# EasyEDA Pro project RM26.epro, board PCB2
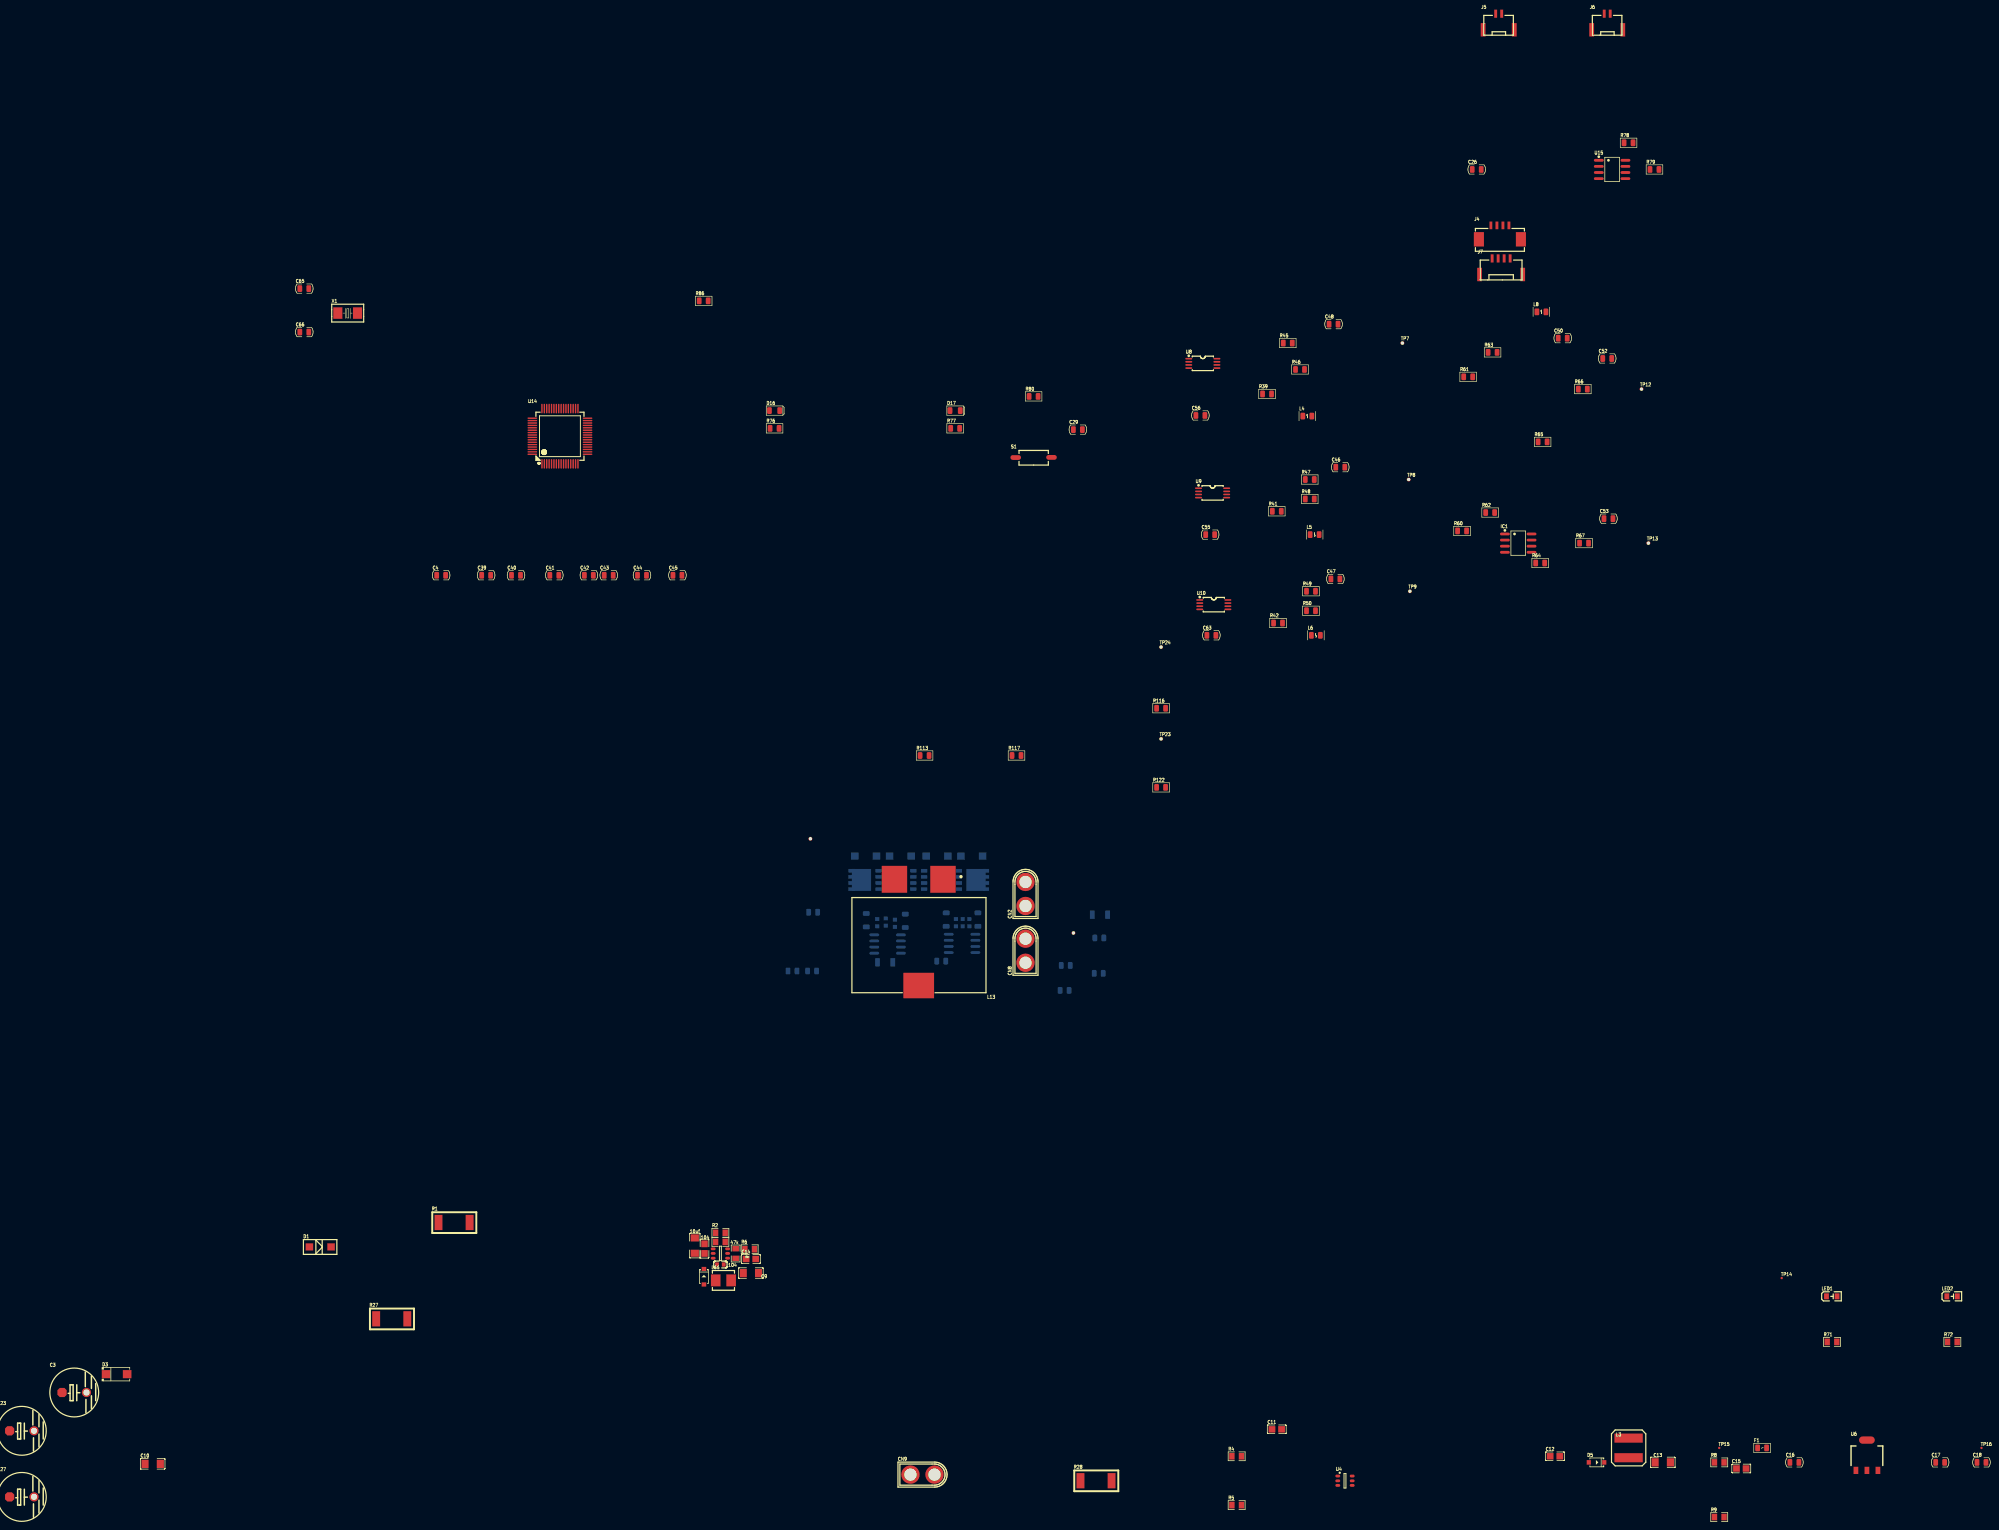
[diagram p2: board, top side]
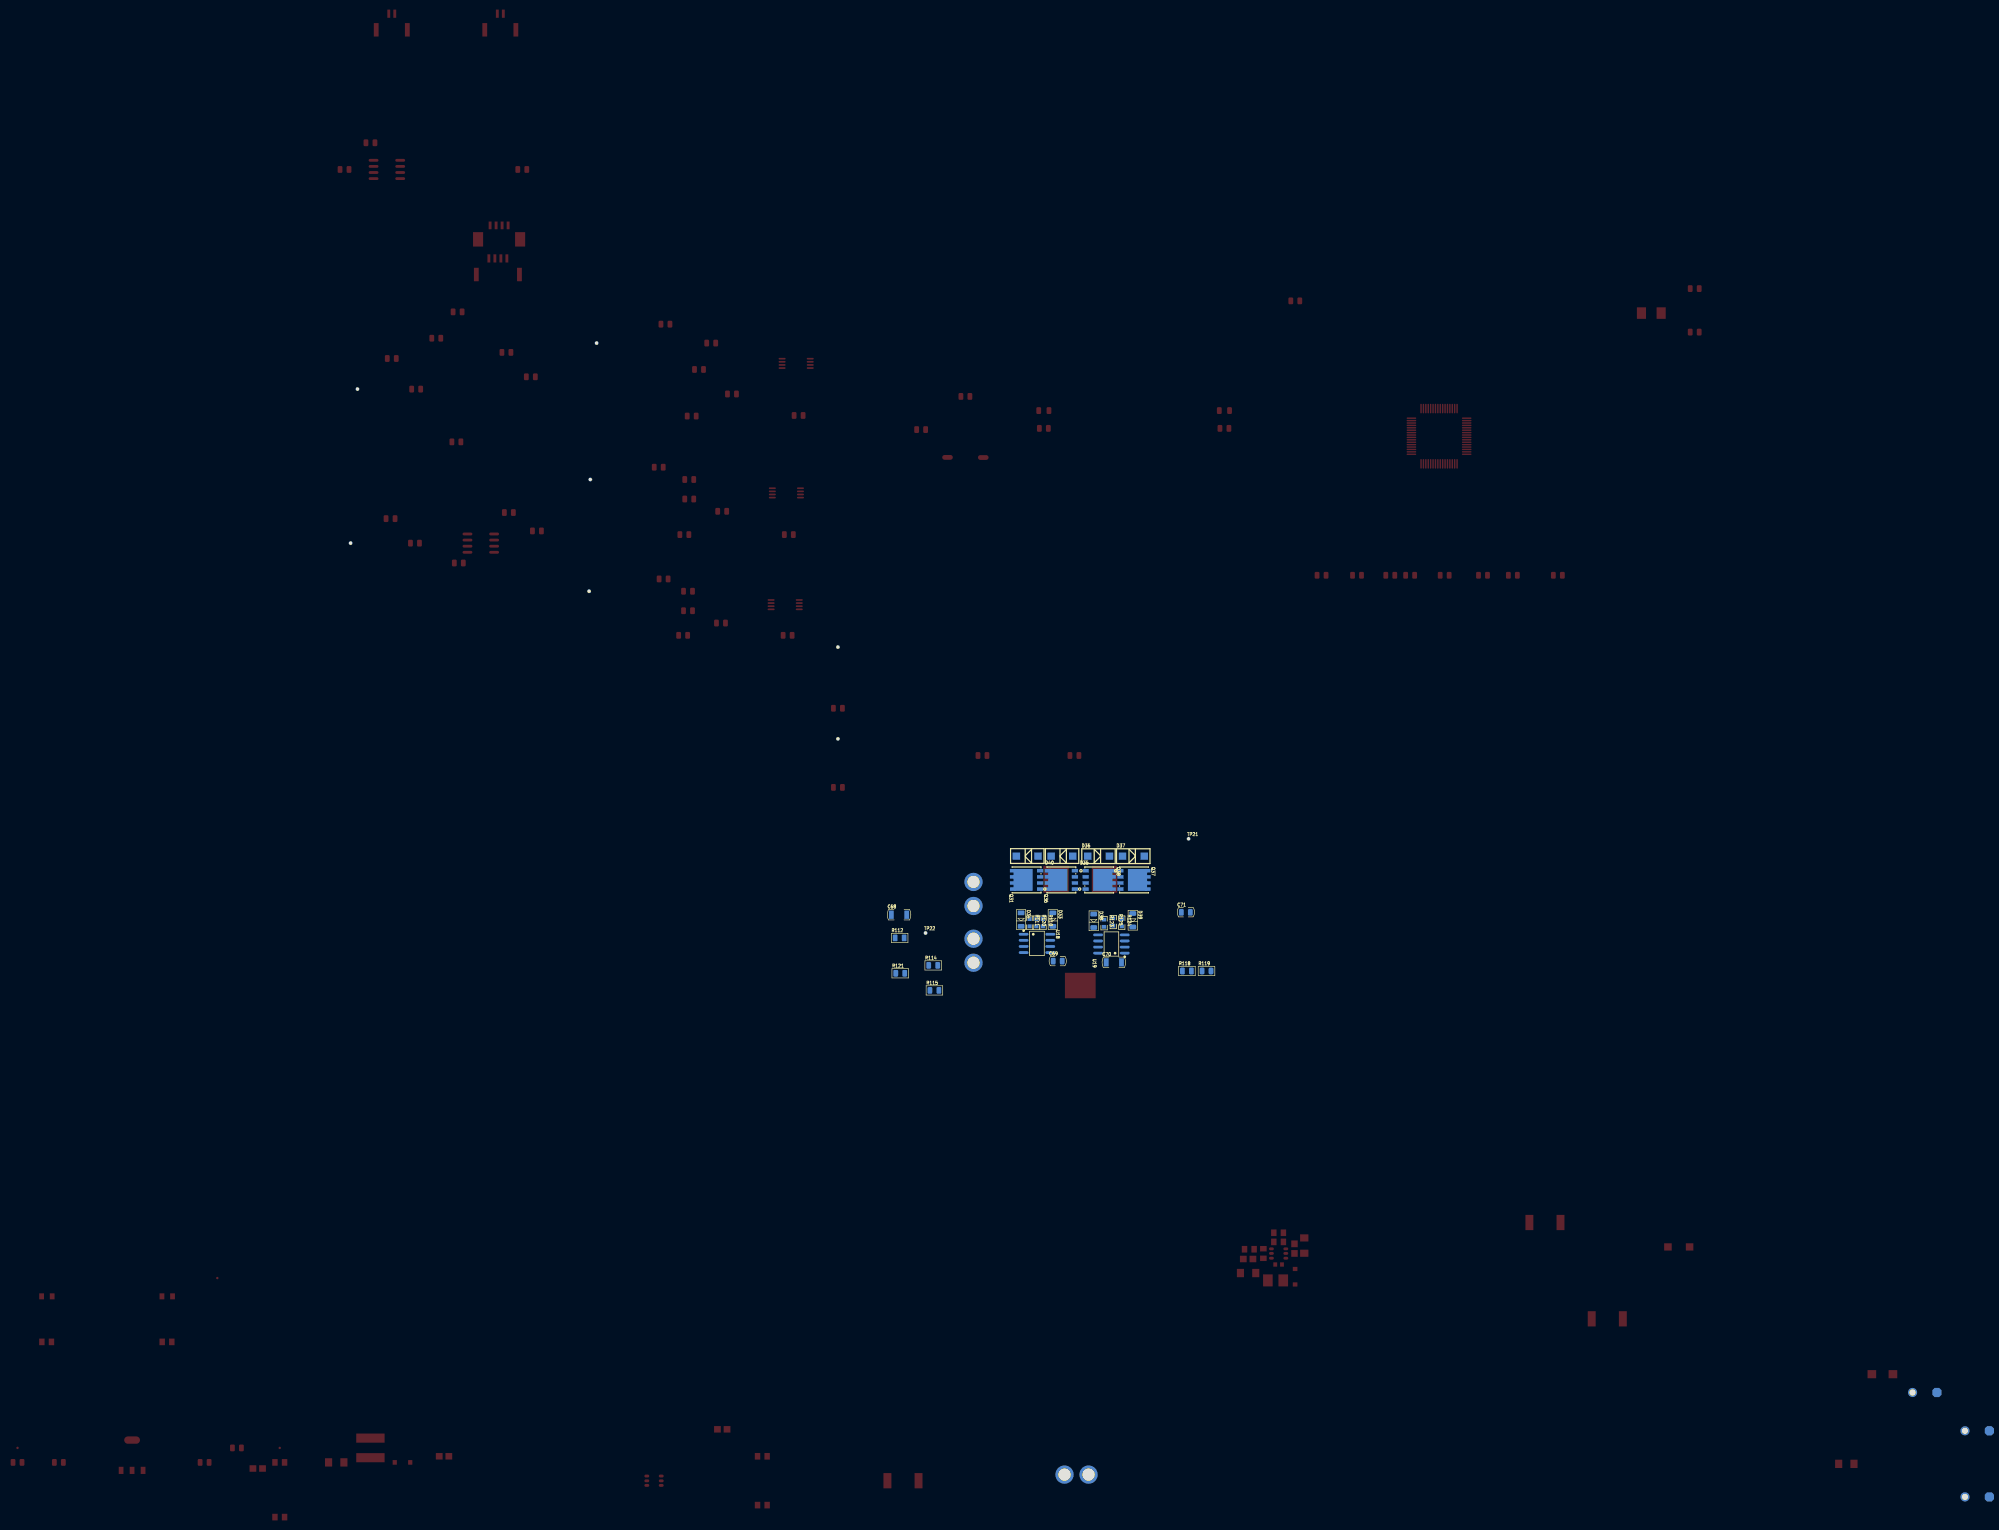
[diagram p3: board, bottom side, seen from below]

No outline. copper layers: Top Layer, Bottom Layer. Coordinates in mm from the lowest, leftmost part position.
Stack: Top Layer 0.035mm / Dielectric1 1.51mm FR4 er 4.5 / Bottom Layer 0.035mm

## Design rules (mm)
template: JLCPCB Capability(Two Layers Board)
spacing copperThickness1oz (default): track to track 0.102, other pairs 0.152 to 0.3
spacing copperThickness2oz: track to track 0.203, other pairs 0.152 to 0.3
track width copperThickness1oz (default): min 0.127, default 0.254, max 2.54
track width copperThickness2oz: min 0.203, default 0.254, max 2.54
differential pair differentialPair (default): width min 0.127, default 0.254, max 2.54; gap min 0.152, default 0.152
via viaSize (default): diameter min 0.5, default 0.61, max 10; hole min 0.3, default 0.305, max 6.3

## Placement (name value [footprint] x y rotation side)
10uf  10uF  [C1206]  140.05 56.48 90 top
47k  47kΩ  [R0805]  145.38 57.25 180 top
104  -  [C0805]  142.08 55.85 90 top
104#2  -  [C0603]  145.38 52.55 180 top
C3  470UF  [C-电解电容]  10.91 25.92 0 top
C4  1UF  [0805-C]  87.27 195.93 0 top
C9  10uF  [C1206]  151.73 50.77 180 top
C10  10uF  [C1206]  27.23 11.07 0 top
C11  104  [C0805]  261.17 18.26 0 top
C12  104  [C0805]  319.07 12.65 0 top
C13  10uF  [C1206]  341.5 11.38 0 top
C14  47pF  [C0805]  151.73 53.69 0 top
C15  33pF  [C0805]  357.84 10.11 0 top
C16  4.7UF  [0805-C]  368.9 11.38 0 top
C17  1UF  [0805-C]  399.23 11.38 0 top
C18  104  [0805-C]  407.83 11.38 0 top
C23  470UF  [C-电解电容]  0 17.95 0 top
C26  104  [0805-C]  302.78 280.36 0 top
C27  470UF  [C-电解电容]  0 4.2 0 top
C29  104  [0805-C]  219.78 226.25 0 top
C39  104  [0805-C]  96.63 195.93 0 top
C40  104  [0805-C]  102.85 195.93 0 top
C41  104  [0805-C]  110.82 195.93 0 top
C42  104  [0805-C]  118.01 195.93 0 top
C43  104  [0805-C]  122.14 195.93 0 top
C44  1UF  [0805-C]  129.06 195.93 0 top
C45  104  [0805-C]  136.44 195.93 0 top
C46  100PF  [0805-C]  274.39 218.42 0 top
C47  100PF  [0805-C]  273.37 195.17 0 top
C48  100PF  [0805-C]  272.99 248.18 0 top
C50  104  [0805-C]  320.68 245.26 0 top
C52  100pf  [0805-C]  329.95 241.04 0 top
C53  100pf  [0805-C]  330.2 207.72 0 top
C55  104  [0805-C]  247.31 204.4 0 top
C56  104  [0805-C]  245.28 229.19 0 top
C63  104  [0805-C]  247.56 183.44 0 top
C65  22PF  [0805-C]  58.79 255.58 0 top
C66  22PF  [0805-C]  58.79 246.53 0 top
C68  4.7UF  [C-1206]  224.38 125.32 180 bottom
C69  104  [0805-C]  191.36 115.67 180 bottom
C70  4.7UF  [C-1206]  179.67 115.41 180 bottom
C71  104  [0805-C]  164.69 125.83 180 bottom
CN2  XT30U-M  [CONN-TH_XT30U-M]  208.88 129.64 90 top
CN8  XT30U-M  [CONN-TH_XT30U-M]  208.88 117.83 90 top
CN9  XT30U-M  [CONN-TH_XT30U-M]  187.44 8.84 0 top
D1  SMBJ30CA  [SMA]  62.1 56.2 0 top
D3  1N5819  [SMA_L4.4-W2.6-LS5.0-RD]  19.73 29.73 0 top
D4  1N4148W  [SOD-123_L2.7-W1.6-LS3.7-FD]  141.95 50.01 90 top
D5  1N4148W  [SOD-123_L2.7-W1.6-LS3.7-FD]  327.72 11.38 0 top
D16  led  [0805-LED]  156.66 230.2 0 top
D17  led  [0805-LED]  194.24 230.2 0 top
D33  1n4148  [1n4148 sod-123]  192.37 124.3 270 bottom
D34  1n4148  [1n4148 sod-123]  198.98 124.3 270 bottom
D35  FR107  [SMA]  190.47 137.51 0 bottom
D36  FR107  [SMA]  182.85 137.51 180 bottom
D37  FR107  [SMA]  175.61 137.51 180 bottom
D38  1n4148  [1n4148 sod-123]  183.86 124.05 270 bottom
D39  1n4148  [1n4148 sod-123]  175.74 124.18 270 bottom
D40  FR107  [SMA]  197.71 137.51 0 bottom
F1  0.5A/0805  [自恢复保险丝-0805]  362.17 14.39 0 top
IC1  OPA2350UA  [OPA2350UA-SOP-8]  311.42 202.62 0 top
J4  CON4  [GH1.25-4P  SWD]  307.61 267.28 0 top
J5  CON2  [GH1.25_2P-立]  307.36 311.09 0 top
J6  CON2  [GH1.25_2P-立]  329.95 311.09 0 top
J7  CON4  [GH1.25_4P-立]  307.86 260.18 0 top
L3  3.3UH/0530  [L-5020/5030]  334.39 14.39 0 top
L4  10UH  [0805-L]  267.53 229.06 0 top
L5  10UH  [0805-L]  269.06 204.4 0 top
L6  10UH  [0805-L]  269.31 183.44 0 top
L8  10UH  [0805-L]  316.25 250.74 0 top
L11  6.8uH  [IND-SMD_L4.6-W4.1_FCH0420]  146.02 49.25 0 top
L13  10uH  [IND-SMD_3P-L27.9-W27.9_PSPQAA2617]  186.66 121.64 180 top
LED1  -  [LED_0805]  376.72 45.92 0 top
LED2  -  [LED_0805]  401.77 45.92 0 top
Q31  BSC066N06NS  [PG-TDSON-8_L5.0-W6.0-P1.27-BL-EP]  197.83 132.56 90 bottom
Q36  BSC066N06NS  [PG-TDSON-8_L5.0-W6.0-P1.27-BL-EP]  190.59 132.56 90 bottom
Q37  BSC066N06NS  [PG-TDSON-8_L5.0-W6.0-P1.27-BL-EP]  175.48 132.56 270 bottom
Q38  BSC066N06NS  [PG-TDSON-8_L5.0-W6.0-P1.27-BL-EP]  182.72 132.56 270 bottom
R1  R005  [R-2512]  89.95 61.28 0 top
R2  200kΩ  [R0805]  145.38 59.15 0 top
R4  200kΩ  [R0805]  252.83 12.65 0 top
R5  47kΩ  [R0805]  252.83 2.49 0 top
R6  124kΩ  [R0805]  151.48 55.72 0 top
R7  8.87kΩ  [R0805]  148.56 54.83 90 top
R8  124kΩ  [R0805]  353.26 11.38 0 top
R9  23.7kΩ  [R0805]  353.26 0 0 top
R27  R005  [R-2512]  76.98 41.25 0 top
R28  R005  [R-2512]  223.56 7.57 0 top
R39  220R  [0805-R]  259.15 233.65 0 top
R41  220R  [0805-R]  261.18 209.24 0 top
R42  220R  [0805-R]  261.44 186 0 top
R45  100R  [0805-R]  263.47 244.24 0 top
R46  220R  [0805-R]  266.01 238.75 0 top
R47  100R  [0805-R]  268.04 215.86 0 top
R48  220R  [0805-R]  268.04 211.8 0 top
R49  100R  [0805-R]  268.29 192.61 0 top
R50  220R  [0805-R]  268.29 188.56 0 top
R60  200K  [0805-R]  299.74 205.16 0 top
R61  200K  [0805-R]  301.01 237.23 0 top
R62  10K  [0805-R]  305.58 208.99 0 top
R63  10K  [0805-R]  306.09 242.31 0 top
R64  10K  [0805-R]  315.99 198.49 0 top
R65  10K  [0805-R]  316.5 223.69 0 top
R66  100R  [0805-R]  324.87 234.67 0 top
R67  100R  [0805-R]  325.12 202.62 0 top
R71  10K  [R0805]  376.72 36.45 0 top
R72  10K  [R0805]  401.77 36.45 0 top
R76  10K  [0805-R]  156.66 226.5 0 top
R77  10K  [0805-R]  194.24 226.5 0 top
R78  10K  [0805-R]  334.38 285.92 0 top
R79  120R  [0805-R]  339.78 280.36 0 top
R80  10K  [0805-R]  210.57 233.15 0 top
R86  10K  [0805-R]  141.91 253.02 0 top
R110  2Ω  [R0603]  194.4 123.67 270 bottom
R111  2Ω  [R0603]  197.2 123.67 270 bottom
R112  10K  [0805-R]  224.25 120.49 180 bottom
R113  10K  [0805-R]  187.88 158.44 0 top
R114  10K  [0805-R]  217.26 114.78 180 bottom
R115  10K  [0805-R]  217.01 109.57 180 bottom
R116  10K  [0805-R]  237.1 168.27 0 top
R117  10K  [0805-R]  207.01 158.44 0 top
R118  10K  [0805-R]  164.46 113.61 180 bottom
R119  10K  [0805-R]  160.38 113.61 180 bottom
R120  4.7Ω  [R0603]  195.8 123.67 270 bottom
R121  10K  [0805-R]  224.12 113.13 180 bottom
R122  10K  [0805-R]  237.1 151.8 0 top
R123  2Ω  [R0603]  181.7 123.54 270 bottom
R124  2Ω  [R0603]  178.02 123.67 270 bottom
R125  4.7Ω  [R0603]  179.8 123.79 270 bottom
S1  -  [按键]  210.57 220.45 0 top
TP7  测试点  [测试点-1MM有孔]  287.31 244.24 0 top
TP8  测试点  [测试点-1MM有孔]  288.62 215.86 0 top
TP9  测试点  [测试点-1MM有孔]  288.88 192.61 0 top
TP12  测试点  [测试点-1MM有孔]  337.08 234.67 0 top
TP13  测试点  [测试点-1MM有孔]  338.51 202.62 0 top
TP14  -  [Test-Point-0.5mm]  366.26 49.73 0 top
TP15  -  [Test-Point-0.5mm]  353.26 14.39 0 top
TP16  -  [Test-Point-0.5mm]  407.83 14.39 0 top
TP21  测试点  [测试点-1MM有孔]  164.12 141.12 180 bottom
TP22  测试点  [测试点-1MM有孔]  218.85 121.52 180 bottom
TP23  测试点  [测试点-1MM有孔]  237.1 161.9 0 top
TP24  测试点  [测试点-1MM有孔]  237.1 181 0 top
U3  mp2451  [MP2451-SOT23-6]  145.38 54.83 180 top
U4  mp2451  [MP2451-SOT23-6]  275.37 7.57 0 top
U6  AMS1117  [AMS117-SOT-223]  383.99 12.87 0 top
U8  INA240A1PWR  [INA240-TSSOP-8]  245.79 240.02 0 top
U9  INA240A1PWR  [INA240-TSSOP-8]  247.82 213.07 0 top
U10  INA240A1PWR  [INA240-TSSOP-8]  248.07 189.83 0 top
U14  STM32G474RET6  [LQFP-64_L10.0-W10.0-P0.50-LS12.0-BL]  111.99 224.87 0 top
U15  SN65HVD230  [SOP-8]  330.96 280.36 0 top
U18  UCC27282DR  [SOIC-8_L4.9-W3.9-P1.27-LS6.0-BL]  195.67 119.35 270 bottom
U19  UCC27282DR  [SOIC-8_L4.9-W3.9-P1.27-LS6.0-BL]  180.18 119.22 90 bottom
X1  8M  [晶振2脚-5032]  67.82 250.48 0 top

## Footprints (pads in the part's own frame, mm; a bottom-side part is the same pattern mirrored in y, then rotated)
1n4148 sod-123
  rrect 1x1.42 smd: 1(-1.397,0) 2(1.397,0)
0805-C
  rrect 1x1.42 smd: 1(-0.935,0) 2(0.935,0)
0805-L
  rrect 1x1.42 smd: 1(-0.935,0) 2(0.935,0)
0805-LED
  rrect 1x1.42 smd: 1(-1.067,0) 2(1.067,0)
0805-R
  rrect 1x1.42 smd: 1(-0.935,0) 2(0.935,0)
AMS117-SOT-223
  rect 0.991x1.498 smd: 1(-2.286,-3.15) 2(0,-3.15) 3(2.286,-3.15)
  oval 3.28x1.524 smd: 2(0,3.15)
C0603
  rect 0.8x0.9 smd: 1(-0.7,0) 2(0.7,0)
C0805
  rect 1.41x1.35 smd: 1(-1,0) 2(1,0)
C1206
  rect 1.485x1.728 smd: 1(-1.593,0) 2(1.593,0)
C-1206
  rect 1x1.728 smd: 1(-1.593,0) 2(1.593,0)
C-电解电容
  custom 1.905x1.905 hole 1.143: 1(-2.54,0)
  round 1.905 hole 1.27: 2(2.54,0)
CONN-TH_XT30U-M
  round 3.8 hole 2.54: 1(-2.5,0) 2(2.5,0)
GH1.25-4P  SWD
  rect 0.6x1.6 smd: 1(-1.875,1.45) 2(-0.625,1.45) 3(0.625,1.45) 4(1.875,1.45)
  rect 2.1x3 smd: 5(4.375,-1.45) 6(-4.375,-1.45)
GH1.25_2P-立
  rect 0.6x1.7 smd: 1(-0.625,1.675) 2(0.625,1.675)
  rect 1x2.8 smd: 3(3.237,-1.675) 4(-3.237,-1.675)
GH1.25_4P-立
  rect 0.6x1.7 smd: 1(-1.875,1.675) 2(-0.625,1.675) 3(0.625,1.675) 4(1.875,1.675)
  rect 1x2.8 smd: 5(4.487,-1.675) 6(-4.487,-1.675)
INA240-TSSOP-8
  oval 1.454x0.353 smd: 1(-2.927,0.975) 2(-2.927,0.325) 3(-2.927,-0.325) 4(-2.927,-0.975) 5(2.927,-0.975) 6(2.927,-0.325) 7(2.927,0.325) 8(2.927,0.975)
IND-SMD_3P-L27.9-W27.9_PSPQAA2617
  rect 5.3x5.6 smd: 1(-5.05,-11.05) 2(5.05,-11.05)
  rect 6.4x5.3 smd: 3(0,11.05)
IND-SMD_L4.6-W4.1_FCH0420
  rect 2x2.5 smd: 1(-1.6,0) 2(1.6,0)
L-5020/5030
  rect 5.9x1.9 smd: 1(0,2.038) 2(0,-2.038)
LED_0805
  rect 1x1.25 smd: 1(-1.15,0.005) 2(1.05,0.005)
LQFP-64_L10.0-W10.0-P0.50-LS12.0-BL
  oval 0.3x2 smd: 1(-3.75,-5.75) 2(-3.25,-5.75) 3(-2.75,-5.75) 4(-2.25,-5.75) 5(-1.75,-5.75) 6(-1.25,-5.75) 7(-0.75,-5.75) 8(-0.25,-5.75) 9(0.25,-5.75) 10(0.75,-5.75) 11(1.25,-5.75) 12(1.75,-5.75) 13(2.25,-5.75) 14(2.75,-5.75) 15(3.25,-5.75) 16(3.75,-5.75) 33(3.75,5.75) 34(3.25,5.75) 35(2.75,5.75) 36(2.25,5.75) 37(1.75,5.75) 38(1.25,5.75) 39(0.75,5.75) 40(0.25,5.75) 41(-0.25,5.75) 42(-0.75,5.75) 43(-1.25,5.75) 44(-1.75,5.75) 45(-2.25,5.75) 46(-2.75,5.75) 47(-3.25,5.75) 48(-3.75,5.75)
  oval 2x0.3 smd: 17(5.75,-3.75) 18(5.75,-3.25) 19(5.75,-2.75) 20(5.75,-2.25) 21(5.75,-1.75) 22(5.75,-1.25) 23(5.75,-0.75) 24(5.75,-0.25) 25(5.75,0.25) 26(5.75,0.75) 27(5.75,1.25) 28(5.75,1.75) 29(5.75,2.25) 30(5.75,2.75) 31(5.75,3.25) 32(5.75,3.75) 49(-5.75,3.75) 50(-5.75,3.25) 51(-5.75,2.75) 52(-5.75,2.25) 53(-5.75,1.75) 54(-5.75,1.25) 55(-5.75,0.75) 56(-5.75,0.25) 57(-5.75,-0.25) 58(-5.75,-0.75) 59(-5.75,-1.25) 60(-5.75,-1.75) 61(-5.75,-2.25) 62(-5.75,-2.75) 63(-5.75,-3.25) 64(-5.75,-3.75)
MP2451-SOT23-6
  oval 1.016x0.6 smd: 1(-1.5,0.975) 2(-1.5,-0.025) 3(-1.5,-0.975) 4(1.5,-0.975) 5(1.5,-0.025) 6(1.5,0.975)
OPA2350UA-SOP-8
  oval 2.045x0.588 smd: 1(-2.772,1.905) 2(-2.772,0.635) 3(-2.772,-0.635) 4(-2.772,-1.905) 5(2.772,-1.905) 6(2.772,-0.635) 7(2.772,0.635) 8(2.772,1.905)
PG-TDSON-8_L5.0-W6.0-P1.27-BL-EP
  rect 0.75x1.3 smd: 1(-1.905,-2.82) 2(-0.635,-2.82) 3(0.635,-2.82) 4(1.905,-2.82) 5(1.905,2.82) 6(0.635,2.82) 7(-0.635,2.82) 8(-1.905,2.794)
  rect 4.56x4 smd: 8(0,0.737)
R0603
  rect 0.806x0.864 smd: 1(-0.753,0) 2(0.753,0)
R0805
  rect 1.133x1.377 smd: 1(-1,0) 2(1,0)
R-2512
  rect 1.651x3.175 smd: 1(-3.238,0) 2(3.238,0)
SMA
  rect 1.57x1.51 smd: 1(-2.255,0) 2(2.255,0)
SMA_L4.4-W2.6-LS5.0-RD
  rect 1.8x1.7 smd: 1(-2.192,0) 2(2.192,0)
SOD-123_L2.7-W1.6-LS3.7-FD
  rect 0.88x0.96 smd: 1(-1.61,0) 2(1.61,0)
SOIC-8_L4.9-W3.9-P1.27-LS6.0-BL
  oval 0.588x2.045 smd: 1(-1.905,-2.772) 2(-0.635,-2.772) 3(0.635,-2.772) 4(1.905,-2.772) 5(1.905,2.772) 6(0.635,2.772) 7(-0.635,2.772) 8(-1.905,2.772)
SOP-8
  oval 2.045x0.588 smd: 1(-2.772,1.905) 2(-2.772,0.635) 3(-2.772,-0.635) 4(-2.772,-1.905) 5(2.772,-1.905) 6(2.772,-0.635) 7(2.772,0.635) 8(2.772,1.905)
Test-Point-0.5mm
  round 0.5 smd: 1(0,0)
按键
  rrect 2.2x1 smd: 1(-3.721,-0.013) 2(3.721,0.013)
晶振2脚-5032
  rect 1.9x2.4 smd: 1(-2.05,0) 2(2.05,0)
测试点-1MM有孔
  round 0.813 hole 0.635: 1(0,0)
自恢复保险丝-0805
  rrect 1x1.42 smd: 1(-0.935,0) 2(0.935,0)

## Nets
As in the schematic, except:
24V: 10uf.1 104.1 C10.1 C11.1 D3.1 R2.2 R4.2 U3.5 U4.5
GND: 10uf.2 47k.1 104.2 C3.2 C4.2 C9.1 C10.2 C11.2 C13.1 C16.2 C17.2 C18.2 C23.2 C26.1 C27.2 C29.2 C39.2 C40.2 C41.2 C42.2 C43.2 C44.2 C45.2 C46.2 C47.2 C48.2 C50.2 C52.2 C53.2 C55.1 C56.1 C63.1 C65.1 C66.2 C68.2 C70.1 CN2.2 CN8.2 CN9.2 D1.1 D4.1 D5.1 D35.1 D36.1 IC1.4 J4.3 J4.5 J4.6 J5.3 J5.4 J6.3 J6.4 J7.3 J7.5 J7.6 Q36.1 Q36.2 Q36.3 Q38.1 Q38.2 Q38.3 R5.1 R7.1 R46.2 R48.2 R50.2 R62.1 R63.1 R71.1 R72.1 R78.1 R86.1 R113.2 R114.2 R115.2 R117.2 R118.2 R119.2 R121.1 R122.1 S1.1 U3.2 U4.2 U6.1 U8.1 U8.4 U8.7 U9.1 U9.4 U9.7 U10.1 U10.4 U10.7 U14.15 U14.31 U14.47 U14.63 U15.2 U18.7 U19.7
$1N14728: 47k.2 R2.1 U3.4
$1N14734: 104#2.2 D4.2 L11.1 U3.6
$1N14735: 104#2.1 U3.1

Pads without a net: J7 4; L13 3; R9 1; U14 1 2 3 4 8 11 46 52 53 54 55 60 62; U15 5
